# Altium project Rover.PrjPcb
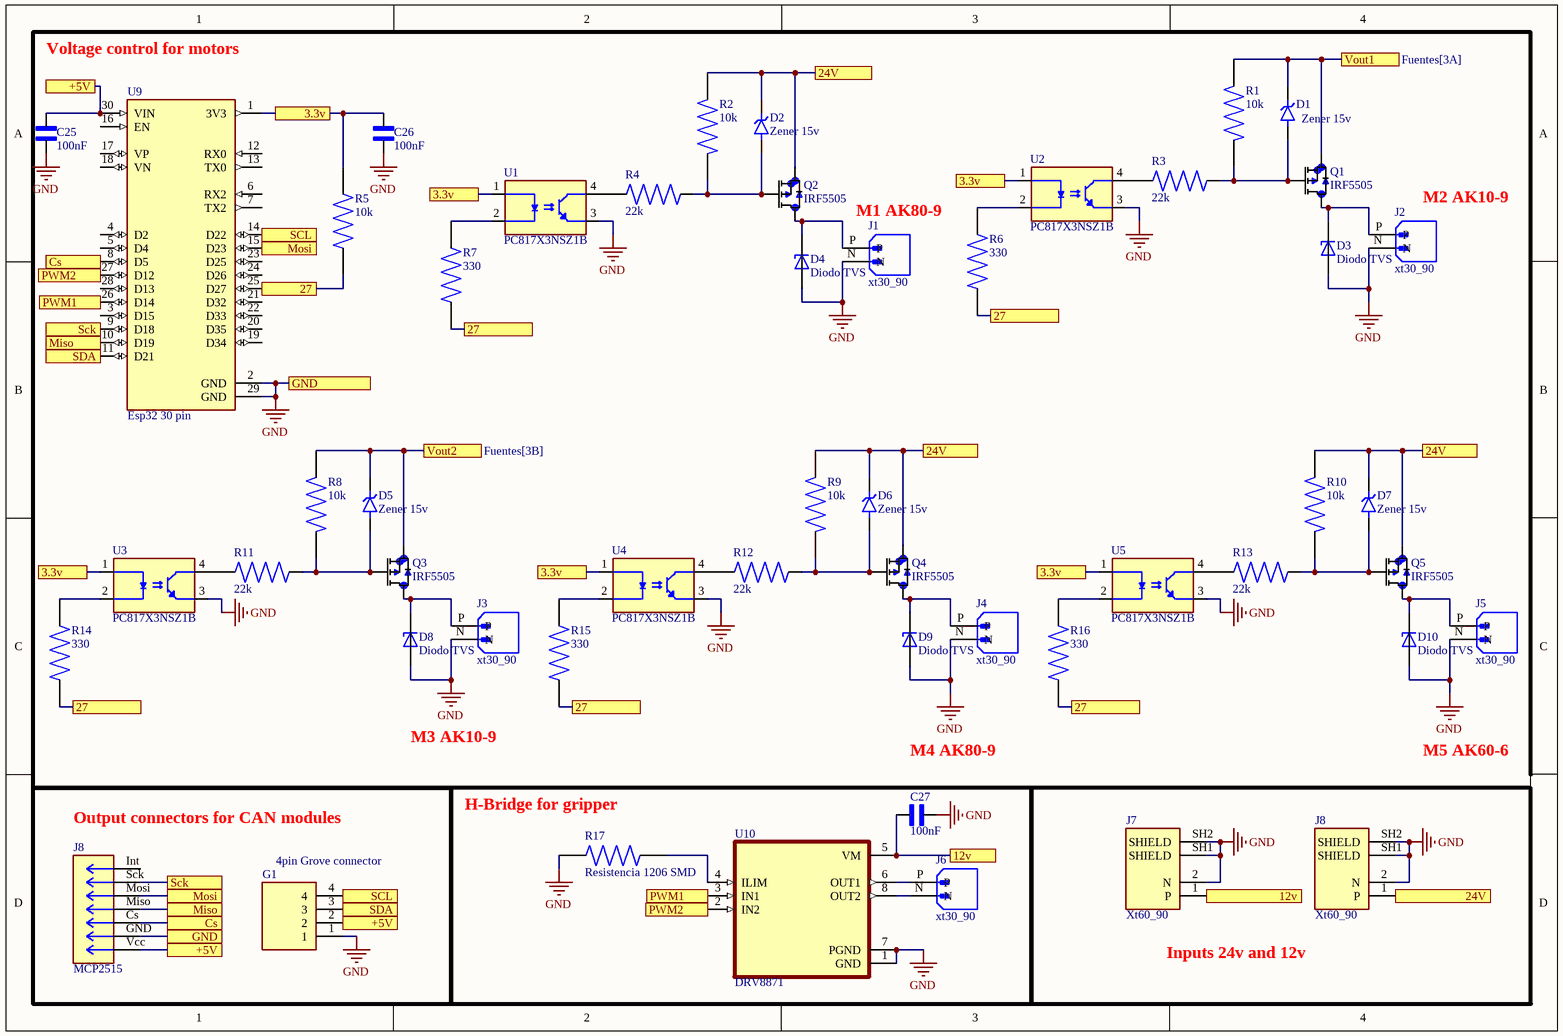
[diagram p0: Control.SchDoc]
2 sheets, 123 parts. Net scope: flat (ports and power ports of the same name join across sheets).
Board file: PCB2.PcbDoc
Sheets:
  Control.SchDoc
  Fuentes.SchDoc

## Sheet Control.SchDoc
size A4; SheetNumber: 1; SheetTotal: 2

### Parts
(Parts that share a designator on the sheet are numbered #1, #2 ... from top to bottom, then left to right.)
C25  100nF  [Cap SMD 1206]
C26  100nF  [Cap SMD 1206]
C27  100nF  [Cap SMD 1206]
D1  Zener 15v  [Zener 15v 500mW SMD]
D2  Zener 15v  [Zener 15v 500mW SMD]
D3  Diodo TVS  [Diodo TVS]
D4  Diodo TVS  [Diodo TVS]
D5  Zener 15v  [Zener 15v 500mW SMD]
D6  Zener 15v  [Zener 15v 500mW SMD]
D7  Zener 15v  [Zener 15v 500mW SMD]
D8  Diodo TVS  [Diodo TVS]
D9  Diodo TVS  [Diodo TVS]
D10  Diodo TVS  [Diodo TVS]
G1  4pin Grove connector  [4 pin grove conector]
J1  xt30_90  [XT30_90]
J2  xt30_90  [XT30_90]
J3  xt30_90  [XT30_90]
J4  xt30_90  [XT30_90]
J5  xt30_90  [XT30_90]
J6  xt30_90  [XT30_90]
J7  Xt60_90  [Xt60_90]
J8#1  Xt60_90  [Xt60_90]
J8#2  MCP2515  [MCP2515]
Q1  IRF5505  [irf5505]
Q2  IRF5505  [irf5505]
Q3  IRF5505  [irf5505]
Q4  IRF5505  [irf5505]
Q5  IRF5505  [irf5505]
R1  10k  [Resistencia 1306]
R2  10k  [Resistencia 1306]
R3  22k  [Resistencia 1306]
R4  22k  [Resistencia 1306]
R5  10k  [Resistencia 1306]
R6  330  [Resistencia 1306]
R7  330  [Resistencia 1306]
R8  10k  [Resistencia 1306]
R9  10k  [Resistencia 1306]
R10  10k  [Resistencia 1306]
R11  22k  [Resistencia 1306]
R12  22k  [Resistencia 1306]
R13  22k  [Resistencia 1306]
R14  330  [Resistencia 1306]
R15  330  [Resistencia 1306]
R16  330  [Resistencia 1306]
R17  Resistencia 1206 SMD  [Resistencia 1306]
U1  PC817X3NSZ1B  [PC817X3NSZ1B]
U2  PC817X3NSZ1B  [PC817X3NSZ1B]
U3  PC817X3NSZ1B  [PC817X3NSZ1B]
U4  PC817X3NSZ1B  [PC817X3NSZ1B]
U5  PC817X3NSZ1B  [PC817X3NSZ1B]
U9  Esp32 30 pin  [ESP32 30 pin]
U10  DRV8871  [DRV8871]

### Blocks framed on the sheet
Output connectors for CAN modules: G1 J8#2
H-Bridge for gripper: C27 J6 R17 U10
Inputs 24v and 12v: J7 J8#1

### Ports
3.3v (see Control[1A], Control[1C], Control[2A], Control[2C], Control[3A], Fuentes[4C]), 3.3v (see Control[1A], Control[1C], Control[2A], Control[2C], Control[3C], Fuentes[4C]), 3.3v (see Control[1A], Control[1C], Control[2A], Control[3A], Control[3C], Fuentes[4C]), 3.3v (see Control[1A], Control[1C], Control[2C], Control[3A], Control[3C], Fuentes[4C]), 3.3v (see Control[1A], Control[2A], Control[2C], Control[3A], Control[3C], Fuentes[4C]), 3.3v (see Control[1C], Control[2A], Control[2C], Control[3A], Control[3C], Fuentes[4C]), 12v (see Control[3D]), 12v (see Control[4D]), 24V (see Control[3A], Control[3B], Control[4B], Fuentes[1A], Fuentes[1B], Fuentes[1C]), 24V (see Control[3A], Control[3B], Control[4D], Fuentes[1A], Fuentes[1B], Fuentes[1C]), 24V (see Control[3A], Control[4B], Control[4D], Fuentes[1A], Fuentes[1B], Fuentes[1C]), 24V (see Control[3B], Control[4B], Control[4D], Fuentes[1A], Fuentes[1B], Fuentes[1C]), 27 (see Control[1B], Control[1C], Control[2B], Control[2C], Control[3B], Fuentes[4C]), 27 (see Control[1B], Control[1C], Control[2B], Control[2C], Control[3C], Fuentes[4C]), 27 (see Control[1B], Control[1C], Control[2B], Control[3B], Control[3C], Fuentes[4C]), 27 (see Control[1B], Control[1C], Control[2C], Control[3B], Control[3C], Fuentes[4C]), 27 (see Control[1B], Control[2B], Control[2C], Control[3B], Control[3C], Fuentes[4C]), 27 (see Control[1C], Control[2B], Control[2C], Control[3B], Control[3C], Fuentes[4C]), +5V (see Control[1A], Control[1D]), +5V (see Control[1D]), Cs (see Control[1B]), Cs (see Control[1D]), GND (see Control[1B]), GND (see Control[1D]), Miso (see Control[1B]), Miso (see Control[1D]), Mosi (see Control[1A]), Mosi (see Control[1D]), PWM1 (see Control[1B]), PWM1 (see Control[2D]), PWM2 (see Control[1B]), PWM2 (see Control[2D]), Sck (see Control[1B]), Sck (see Control[1D]), SCL (see Control[1A]), SCL (see Control[1D]), SDA (see Control[1B]), SDA (see Control[1D]), Vout1 (see Fuentes[3A]), Vout2 (see Fuentes[3B])

### Nets
GND: C25.2 C26.2 C27.1 D3.A D4.A D8.A D9.A D10.A G1.1 J1.N J2.N J3.N J4.N J5.N J7.2(N) J7.SH1(SHIELD) J7.SH2(SHIELD) J8#1.2(N) J8#1.SH1(SHIELD) J8#1.SH2(SHIELD) J8#2.GND R17.2 U1.3(EMITTER) U2.3(EMITTER) U3.3(EMITTER) U4.3(EMITTER) U5.3(EMITTER) U9.2(GND) U9.29(GND) U10.1(GND) U10.7(PGND) ; port GND
NetC1_1: D2.1(K) D6.1(K) D7.1(K) J8#1.1(P) Q2.3(S) Q4.3(S) Q5.3(S) R2.1 R9.1 R10.1 ; port 24V
NetC7_1: D1.1(K) Q1.3(S) R1.1 ; port Vout1
NetC11_1: D5.1(K) Q3.3(S) R8.1 ; port Vout2
NetC25_1: C25.1 G1.2 J8#2.Vcc U9.30(VIN) ; port +5V
NetC26_1: C26.1 R5.1 U1.1(ANODE) U2.1(ANODE) U3.1(ANODE) U4.1(ANODE) U5.1(ANODE) U9.1(3V3) ; port 3.3v
NetC27_2: C27.2 J7.1(P) U10.5(VM) ; port 12v
NetD1_2: D1.2(A) Q1.1(G) R1.2 R3.2
NetD2_2: D2.2(A) Q2.1(G) R2.2 R4.2
NetD3_C: D3.C J2.P Q1.2(D)
NetD4_C: D4.C J1.P Q2.2(D)
NetD5_2: D5.2(A) Q3.1(G) R8.2 R11.2
NetD6_2: D6.2(A) Q4.1(G) R9.2 R12.2
NetD7_2: D7.2(A) Q5.1(G) R10.2 R13.2
NetD8_C: D8.C J3.P Q3.2(D)
NetD9_C: D9.C J4.P Q4.2(D)
NetD10_C: D10.C J5.P Q5.2(D)
NetG1_3: G1.3 U9.11(D21) ; port SDA
NetG1_4: G1.4 U9.14(D22) ; port SCL
NetJ6_N: J6.N U10.8(OUT2)
NetJ6_P: J6.P U10.6(OUT1)
NetJ8#2_Cs: J8#2.Cs U9.8(D5) ; port Cs
NetJ8#2_Miso: J8#2.Miso U9.10(D19) ; port Miso
NetJ8#2_Mosi: J8#2.Mosi U9.15(D23) ; port Mosi
NetJ8#2_Sck: J8#2.Sck U9.9(D18) ; port Sck
NetR3_1: R3.1 U2.4(COLLECTOR)
NetR4_1: R4.1 U1.4(COLLECTOR)
NetR5_2: R5.2 R6.2 R7.2 R14.2 R15.2 R16.2 U9.25(D27) ; port 27
NetR6_1: R6.1 U2.2(CATHODE)
NetR7_1: R7.1 U1.2(CATHODE)
NetR11_1: R11.1 U3.4(COLLECTOR)
NetR12_1: R12.1 U4.4(COLLECTOR)
NetR13_1: R13.1 U5.4(COLLECTOR)
NetR14_1: R14.1 U3.2(CATHODE)
NetR15_1: R15.1 U4.2(CATHODE)
NetR16_1: R16.1 U5.2(CATHODE)
NetR17_1: R17.1 U10.4(ILIM)
NetU9_26: U9.26(D14) U10.3(IN1) ; port PWM1
NetU9_27: U9.27(D12) U10.2(IN2) ; port PWM2

Not connected (* = marked no-connect by the designer): J8#2 Int(7); U9 3(D15) 4(D2) 5(D4) 6(RX2) 7(TX2) 12(RX0) 13(TX0) 16(EN) 17(VP) 18(VN) 19(D34) 20(D35) 21(D32) 22(D33) 23(D25) 24(D26) 28(D13)

### Notes on the sheet
- Voltage control for motors
- (near J1) M1 AK80-9
- (near J2) M2 AK10-9
- M3 AK10-9
- M4 AK80-9
- M5 AK60-6

### Library data of the parts
C25-C27 = Cap SMD 1206
D1 D2 D5-D7 = Zener 15v 500mW SMD
D3 D4 D8-D10 = Diodo TVS SMAJ51
R1-R17 = Resistencia 1306 SMD
U9 = Esp32 30 pin: Dual core, Wi-Fi: 2.4 GHz up to 150 Mbits/s,BLE (Bluetooth Low Energy) and legacy Bluetooth, 32 bits, Up to 240 MHz

## Sheet Fuentes.SchDoc
size A4; SheetNumber: 2; SheetTotal: 2
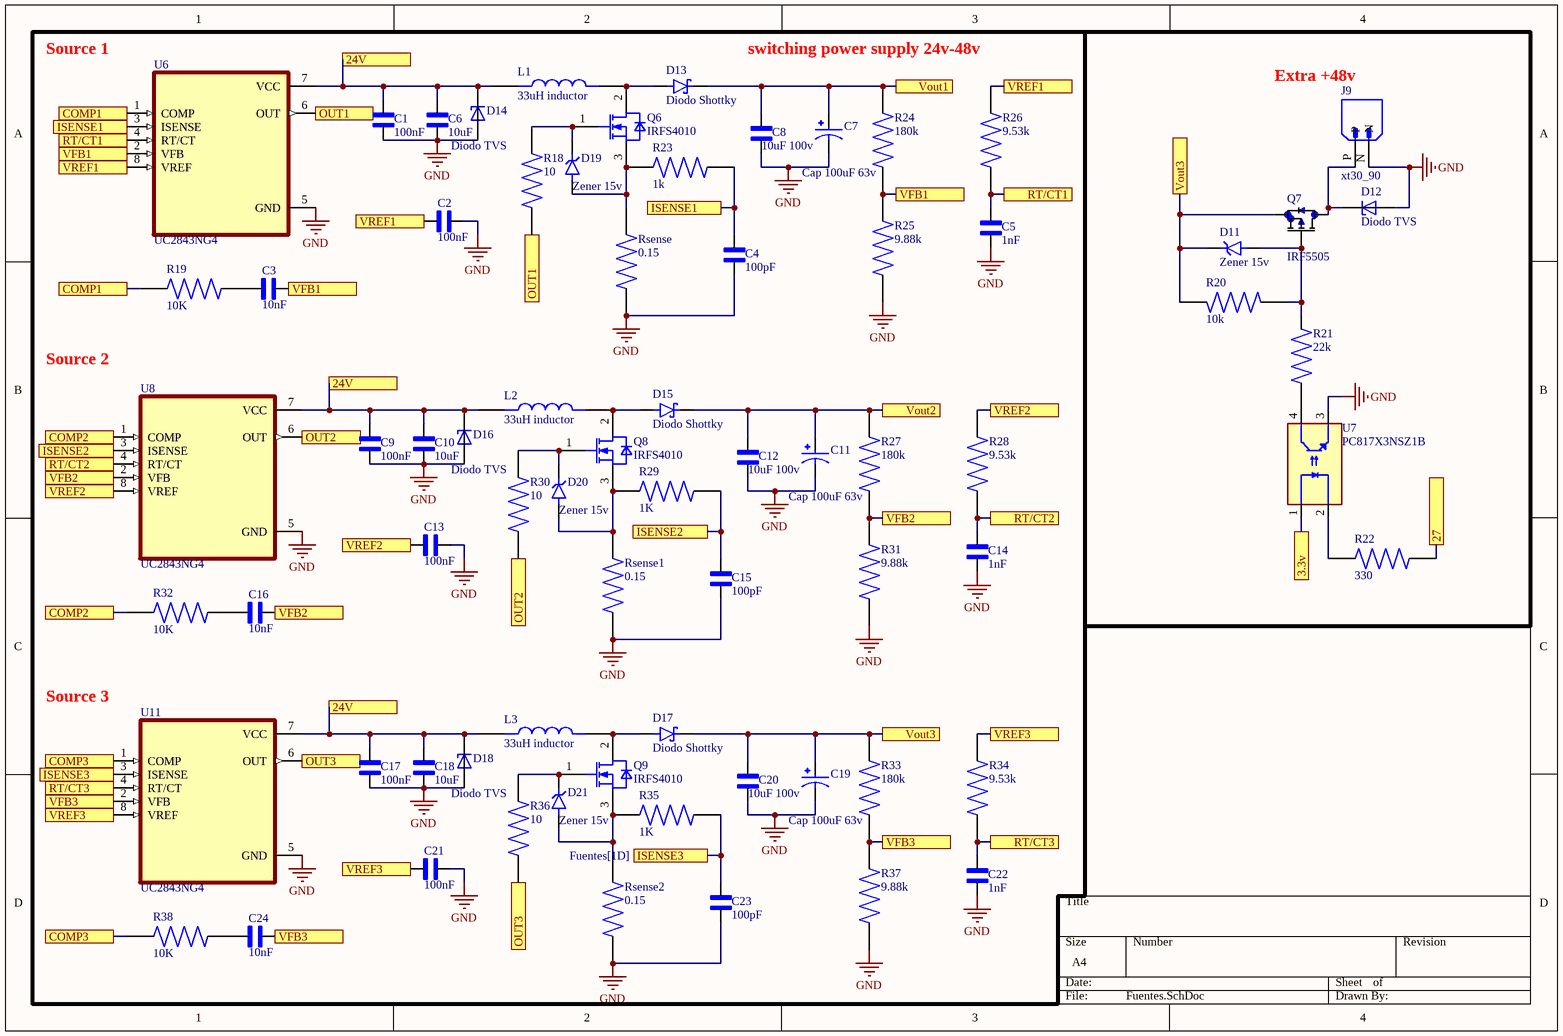
[diagram p1: Fuentes.SchDoc]

### Parts
C1  100nF  [Cap SMD 1206]
C2  100nF  [Cap SMD 1206]
C3  10nF  [Cap SMD 1206]
C4  100pF  [Cap SMD 1206]
C5  1nF  [Cap SMD 1206]
C6  10uF  [Cap SMD 1206]
C7  Cap 100uF 63v  [Cap 100uH 63v]
C8  10uF 100v  [Cap SMD 1210]
C9  100nF  [Cap SMD 1206]
C10  10uF  [Cap SMD 1206]
C11  Cap 100uF 63v  [Cap 100uH 63v]
C12  10uF 100v  [Cap SMD 1210]
C13  100nF  [Cap SMD 1206]
C14  1nF  [Cap SMD 1206]
C15  100pF  [Cap SMD 1206]
C16  10nF  [Cap SMD 1206]
C17  100nF  [Cap SMD 1206]
C18  10uF  [Cap SMD 1206]
C19  Cap 100uF 63v  [Cap 100uH 63v]
C20  10uF 100v  [Cap SMD 1210]
C21  100nF  [Cap SMD 1206]
C22  1nF  [Cap SMD 1206]
C23  100pF  [Cap SMD 1206]
C24  10nF  [Cap SMD 1206]
D11  Zener 15v  [Zener 15v 500mW SMD]
D12  Diodo TVS  [Diodo TVS]
D13  Diodo Shottky  [Diodo Sottky SS510FSH]
D14  Diodo TVS  [Diodo SMAJ28A TVS]
D15  Diodo Shottky  [Diodo Sottky SS510FSH]
D16  Diodo TVS  [Diodo SMAJ28A TVS]
D17  Diodo Shottky  [Diodo Sottky SS510FSH]
D18  Diodo TVS  [Diodo SMAJ28A TVS]
D19  Zener 15v  [Zener 15v 500mW SMD]
D20  Zener 15v  [Zener 15v 500mW SMD]
D21  Zener 15v  [Zener 15v 500mW SMD]
J9  xt30_90  [XT30_90]
L1  33uH inductor  [33uH Inductor]
L2  33uH inductor  [33uH Inductor]
L3  33uH inductor  [33uH Inductor]
Q6  IRFS4010  [IRFS4010]
Q7  IRF5505  [irf5505]
Q8  IRFS4010  [IRFS4010]
Q9  IRFS4010  [IRFS4010]
R18  10  [Resistencia 1306]
R19  10K  [Resistencia 1306]
R20  10k  [Resistencia 1306]
R21  22k  [Resistencia 1306]
R22  330  [Resistencia 1306]
R23  1k  [Resistencia 1306]
R24  180k  [Resistencia 1306]
R25  9.88k  [Resistencia 1306]
R26  9.53k  [Resistencia 1306]
R27  180k  [Resistencia 1306]
R28  9.53k  [Resistencia 1306]
R29  1K  [Resistencia 1306]
R30  10  [Resistencia 1306]
R31  9.88k  [Resistencia 1306]
R32  10K  [Resistencia 1306]
R33  180k  [Resistencia 1306]
R34  9.53k  [Resistencia 1306]
R35  1K  [Resistencia 1306]
R36  10  [Resistencia 1306]
R37  9.88k  [Resistencia 1306]
R38  10K  [Resistencia 1306]
Rsense  0.15  [R SMD 2512]
Rsense1  0.15  [R SMD 2512]
Rsense2  0.15  [R SMD 2512]
U6  UC2843NG4  [UC3843]
U7  PC817X3NSZ1B  [PC817X3NSZ1B]
U8  UC2843NG4  [UC3843]
U11  UC2843NG4  [UC3843]

### Ports
3.3v (see Control[1A], Control[1C], Control[2A], Control[2C], Control[3A], Control[3C]), 24V (see Control[3A], Control[3B], Control[4B], Control[4D], Fuentes[1A], Fuentes[1B]), 24V (see Control[3A], Control[3B], Control[4B], Control[4D], Fuentes[1A], Fuentes[1C]), 24V (see Control[3A], Control[3B], Control[4B], Control[4D], Fuentes[1B], Fuentes[1C]), 27 (see Control[1B], Control[1C], Control[2B], Control[2C], Control[3B], Control[3C]), COMP1 (see Fuentes[1A]), COMP1 (see Fuentes[1B]), COMP2 (see Fuentes[1B]), COMP2 (see Fuentes[1C]), COMP3 (see Fuentes[1C]), COMP3 (see Fuentes[1D]), ISENSE1 (see Fuentes[1A]), ISENSE1 (see Fuentes[2A]), ISENSE2 (see Fuentes[1B]), ISENSE2 (see Fuentes[2C]), ISENSE3 (see Fuentes[1D]), ISENSE3 (see Fuentes[2D]), OUT1 (see Fuentes[1A]), OUT1 (see Fuentes[2B]), OUT2 (see Fuentes[1B]), OUT2 (see Fuentes[2C]), OUT3 (see Fuentes[1C]), OUT3 (see Fuentes[2D]), RT/CT1 (see Fuentes[1A]), RT/CT1 (see Fuentes[3A]), RT/CT2 (see Fuentes[1B]), RT/CT2 (see Fuentes[3C]), RT/CT3 (see Fuentes[1D]), RT/CT3 (see Fuentes[3D]), VFB1 (see Fuentes[1A], Fuentes[1B]), VFB1 (see Fuentes[1A], Fuentes[3A]), VFB1 (see Fuentes[1B], Fuentes[3A]), VFB2 (see Fuentes[1B], Fuentes[1C]), VFB2 (see Fuentes[1B], Fuentes[3C]), VFB2 (see Fuentes[1C], Fuentes[3C]), VFB3 (see Fuentes[1D]), VFB3 (see Fuentes[1D], Fuentes[3D]), Vout1 (see Control[4A]), Vout2 (see Control[2B]), Vout3 (see Fuentes[3C]), Vout3 (see Fuentes[4A]), VREF1 (see Fuentes[1A]), VREF1 (see Fuentes[1A], Fuentes[3A]), VREF2 (see Fuentes[1B], Fuentes[1C]), VREF2 (see Fuentes[1B], Fuentes[3B]), VREF2 (see Fuentes[1C], Fuentes[3B]), VREF3 (see Fuentes[1D]), VREF3 (see Fuentes[1D], Fuentes[3C])

### Nets
GND: C1.2 C2.2 C4.2 C5.2 C6.1 C7.2 C8.1 C9.2 C10.1 C11.2 C12.1 C13.2 C14.2 C15.2 C17.2 C18.1 C19.2 C20.1 C21.2 C22.2 C23.2 D12.A D14.A D16.A D18.A J9.N R25.1 R31.1 R37.1 Rsense.1 Rsense1.1 Rsense2.1 U6.5(GND) U7.3(EMITTER) U8.5(GND) U11.5(GND)
NetC1_1: C1.1 C6.2 C9.1 C10.2 C17.1 C18.2 D14.C D16.C D18.C L1.1 L2.1 L3.1 U6.7(VCC) U8.7(VCC) U11.7(VCC) ; port 24V
NetC2_1: C2.1 R26.1 U6.8(VREF) ; port VREF1
NetC3_1: C3.1 R24.1 R25.2 U6.2(VFB) ; port VFB1
NetC3_2: C3.2 R19.1
NetC4_1: C4.1 R23.1 U6.3(ISENSE) ; port ISENSE1
NetC5_1: C5.1 R26.2 U6.4(RT/CT) ; port RT/CT1
NetC7_1: C7.1 C8.2 D13.C(K) R24.2 ; port Vout1
NetC11_1: C11.1 C12.2 D15.C(K) R27.2 ; port Vout2
NetC13_1: C13.1 R28.1 U8.8(VREF) ; port VREF2
NetC14_1: C14.1 R28.2 U8.4(RT/CT) ; port RT/CT2
NetC15_1: C15.1 R29.2 U8.3(ISENSE) ; port ISENSE2
NetC16_1: C16.1 R27.1 R31.2 U8.2(VFB) ; port VFB2
NetC16_2: C16.2 R32.1
NetC19_1: C19.1 C20.2 D11.1(K) D17.C(K) Q7.3(S) R20.1 R33.2 ; port Vout3
NetC21_1: C21.1 R34.1 U11.8(VREF) ; port VREF3
NetC22_1: C22.1 R34.2 U11.4(RT/CT) ; port RT/CT3
NetC23_1: C23.1 R35.2 U11.3(ISENSE) ; port ISENSE3
NetC24_1: C24.1 R33.1 R37.2 U11.2(VFB) ; port VFB3
NetC24_2: C24.2 R38.1
NetC26_1: U7.1(ANODE) ; port 3.3v
NetD11_2: D11.2(A) Q7.1(G) R20.2 R21.2
NetD12_C: D12.C J9.P Q7.2(D)
NetD13_A: D13.A L1.2 Q6.2(DRAIN)
NetD15_A: D15.A L2.2 Q8.2(DRAIN)
NetD17_A: D17.A L3.2 Q9.2(DRAIN)
NetD19_1: D19.1(K) Q6.1(GATE) R18.2
NetD19_2: D19.2(A) Q6.3(SOURCE) R23.2 Rsense.2
NetD20_1: D20.1(K) Q8.1(GATE) R30.2
NetD20_2: D20.2(A) Q8.3(SOURCE) R29.1 Rsense1.2
NetD21_1: D21.1(K) Q9.1(GATE) R36.2
NetD21_2: D21.2(A) Q9.3(SOURCE) R35.1 Rsense2.2
NetR5_2: R22.2 ; port 27
NetR18_1: R18.1 U6.6(OUT) ; port OUT1
NetR19_2: R19.2 U6.1(COMP) ; port COMP1
NetR21_1: R21.1 U7.4(COLLECTOR)
NetR22_1: R22.1 U7.2(CATHODE)
NetR30_1: R30.1 U8.6(OUT) ; port OUT2
NetR32_2: R32.2 U8.1(COMP) ; port COMP2
NetR36_1: R36.1 U11.6(OUT) ; port OUT3
NetR38_2: R38.2 U11.1(COMP) ; port COMP3

### Notes on the sheet
- (near U6) Source 1
- switching power supply 24v-48v
- Extra +48v
- (near U8) Source 2
- (near U11) Source 3

### Library data of the parts
C1-C6 C9 C10 C13-C18 C21-C24 = Cap SMD 1206
C7 C11 C19 = Cap 100uH 63v
C8 C12 C20 = Cap SMD 1210
D11 D19-D21 = Zener 15v 500mW SMD
D12 = Diodo TVS SMAJ51
D14 D16 D18 = Diodo SMAJ28A TVS
R18-R38 = Resistencia 1306 SMD
Rsense Rsense1 Rsense2 = R SMD 2512

## Nets that join several sheets
GND: Control (31 pins), Fuentes (36 pins)
NetC1_1: Control (10 pins), Fuentes (15 pins)
NetC7_1: Control (D1.1 Q1.3 R1.1), Fuentes (C7.1 C8.2 D13.C R24.2)
NetC11_1: Control (D5.1 Q3.3 R8.1), Fuentes (C11.1 C12.2 D15.C R27.2)
NetC26_1: Control (8 pins), Fuentes (U7.1)
NetR5_2: Control (7 pins), Fuentes (R22.2)